# Altium schematic sheet Servo3.SchDoc
size 420 x 297 mm; SheetNumber: 17; SheetTotal: 26
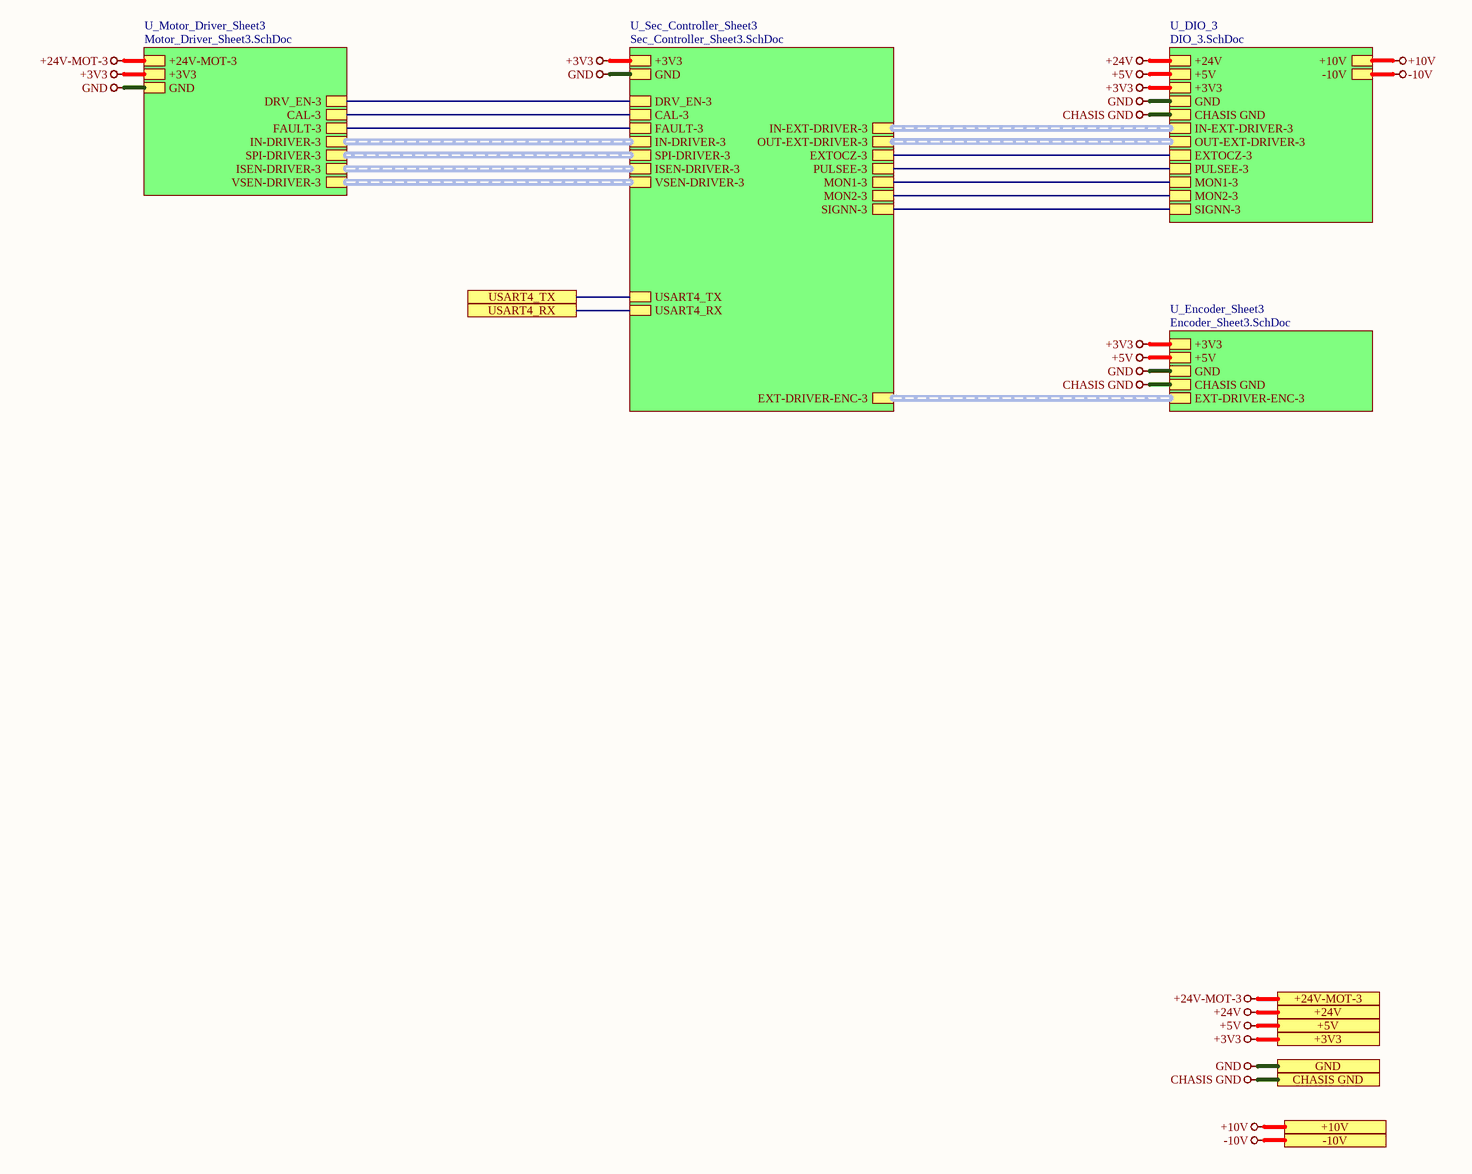
[diagram p0: Servo3.SchDoc]

## Sub-sheets
U_DIO_3 = DIO_3.SchDoc: +24V, +5V, GND, +3V3, CHASIS GND, IN-EXT-DRIVER-3 (harness IN-EXT-DRIVER-3), OUT-EXT-DRIVER-3 (harness OUT-EXT-DRIVER-3), EXTOCZ-3, PULSEE-3, MON1-3, MON2-3, SIGNN-3, +10V, -10V
U_Encoder_Sheet3 = Encoder_Sheet3.SchDoc: +3V3, +5V, GND, CHASIS GND, EXT-DRIVER-ENC-3 (harness EXT-DRIVER-ENC-3)
U_Motor_Driver_Sheet3 = Motor_Driver_Sheet3.SchDoc: +24V-MOT-3, +3V3, GND, DRV_EN-3, CAL-3, FAULT-3, IN-DRIVER-3 (harness IN-DRIVER-3), SPI-DRIVER-3 (harness SPI-DRIVER-3), ISEN-DRIVER-3 (harness ISEN-DRIVER-3), VSEN-DRIVER-3 (harness VSEN-DRIVER-3)
U_Sec_Controller_Sheet3 = Sec_Controller_Sheet3.SchDoc: +3V3, GND, IN-DRIVER-3 (harness IN-DRIVER-3), DRV_EN-3, CAL-3, FAULT-3, SPI-DRIVER-3 (harness SPI-DRIVER-3), ISEN-DRIVER-3 (harness ISEN-DRIVER-3), EXT-DRIVER-ENC-3 (harness EXT-DRIVER-ENC-3), IN-EXT-DRIVER-3 (harness IN-EXT-DRIVER-3), OUT-EXT-DRIVER-3 (harness OUT-EXT-DRIVER-3), EXTOCZ-3, PULSEE-3, MON1-3, MON2-3, SIGNN-3, USART4_TX, USART4_RX, VSEN-DRIVER-3 (harness VSEN-DRIVER-3)

## Ports
+3V3 (see Top_Sheet[5B], CAN_Sheet[4D], Controller_Sheet[5D], DIO_1[5D], DIO_2[5D], DIO_3[5D], DIO_4[5D], Encoder_Sheet1[5D], Encoder_Sheet2[4D], Encoder_Sheet3[4D], Encoder_Sheet4[5D], EtherCAT_Sheet[5D], Motor_Driver_Sheet1[5D], Motor_Driver_Sheet2[5D], Motor_Driver_Sheet3[5D], Motor_Driver_Sheet4[5D], Power_Sheet[5D], RS485_RS232_Sheet[5D], Sec_Controller_Sheet1[5D], Sec_Controller_Sheet2[5D], Sec_Controller_Sheet3[5D], Sec_Controller_Sheet4[5D], Servo1[5D], Servo2[5D], Servo4[5D]), +5V (see Top_Sheet[5B], CAN_Sheet[4D], Controller_Sheet[5D], DIO_1[5D], DIO_2[5D], DIO_3[5D], DIO_4[5D], Encoder_Sheet1[5D], Encoder_Sheet2[4D], Encoder_Sheet3[4D], Encoder_Sheet4[5D], Power_Sheet[5D], Servo1[5D], Servo2[5D], Servo4[5D]), +10V (see Top_Sheet[5C], DIO_1[5D], DIO_2[5D], DIO_3[5D], DIO_4[5D], Power_Sheet[5D], Servo1[5D], Servo2[5D], Servo4[5D]), +24V (see Top_Sheet[5B], DIO_1[5D], DIO_2[5D], DIO_3[5D], DIO_4[5D], Power_Sheet[5D], Servo1[5D], Servo2[5D], Servo4[5D]), +24V-MOT-3 (see Top_Sheet[5C], Motor_Driver_Sheet3[5D], Power_Sheet[5D]), -10V (see Top_Sheet[5C], DIO_1[5D], DIO_2[5D], DIO_3[5D], DIO_4[5D], Power_Sheet[5D], Servo1[5D], Servo2[5D], Servo4[5D]), CHASIS GND (see Top_Sheet[5B], DIO_1[5D], DIO_2[5D], DIO_3[5D], DIO_4[5D], Encoder_Sheet1[5D], Encoder_Sheet2[4D], Encoder_Sheet3[4D], Encoder_Sheet4[5D], EtherCAT_Sheet[5D], Power_Sheet[5D], Servo1[5D], Servo2[5D], Servo4[5D]), GND (see Top_Sheet[5B], CAN_Sheet[4D], Controller_Sheet[5D], DIO_1[5D], DIO_2[5D], DIO_3[5D], DIO_4[5D], Encoder_Sheet1[5D], Encoder_Sheet2[4D], Encoder_Sheet3[4D], Encoder_Sheet4[5D], EtherCAT_Sheet[5D], Motor_Driver_Sheet1[5D], Motor_Driver_Sheet2[5D], Motor_Driver_Sheet3[5D], Motor_Driver_Sheet4[5D], Power_Sheet[5D], RS485_RS232_Sheet[5D], Sec_Controller_Sheet1[5D], Sec_Controller_Sheet2[5D], Sec_Controller_Sheet3[5D], Sec_Controller_Sheet4[5D], Servo1[5D], Servo2[5D], Servo4[5D]), USART4_RX (see Top_Sheet[5B], Controller_Sheet[4D], Sec_Controller_Sheet3[5D]), USART4_TX (see Top_Sheet[5B], Controller_Sheet[4D], Sec_Controller_Sheet3[5D])

## Nets
+3V3: port +3V3, sheet U_Sec_Controller_Sheet3/+3V3, sheet U_Motor_Driver_Sheet3/+3V3, sheet U_Encoder_Sheet3/+3V3, sheet U_DIO_3/+3V3
+5V: port +5V, sheet U_Encoder_Sheet3/+5V, sheet U_DIO_3/+5V
+10V: port +10V, sheet U_DIO_3/+10V
+24V: port +24V, sheet U_DIO_3/+24V
+24V-MOT-3: port +24V-MOT-3, sheet U_Motor_Driver_Sheet3/+24V-MOT-3
-10V: port -10V, sheet U_DIO_3/-10V
CHASIS GND: port CHASIS GND, sheet U_Encoder_Sheet3/CHASIS GND, sheet U_DIO_3/CHASIS GND
GND: port GND, sheet U_Sec_Controller_Sheet3/GND, sheet U_Motor_Driver_Sheet3/GND, sheet U_Encoder_Sheet3/GND, sheet U_DIO_3/GND
USART4_RX: port USART4_RX, sheet U_Sec_Controller_Sheet3/USART4_RX
USART4_TX: port USART4_TX, sheet U_Sec_Controller_Sheet3/USART4_TX
(unnamed): sheet U_Sec_Controller_Sheet3/DRV_EN-3, sheet U_Motor_Driver_Sheet3/DRV_EN-3
(unnamed): sheet U_Sec_Controller_Sheet3/CAL-3, sheet U_Motor_Driver_Sheet3/CAL-3
(unnamed): sheet U_Sec_Controller_Sheet3/FAULT-3, sheet U_Motor_Driver_Sheet3/FAULT-3
(unnamed): sheet U_Sec_Controller_Sheet3/EXTOCZ-3, sheet U_DIO_3/EXTOCZ-3
(unnamed): sheet U_Sec_Controller_Sheet3/PULSEE-3, sheet U_DIO_3/PULSEE-3
(unnamed): sheet U_Sec_Controller_Sheet3/MON1-3, sheet U_DIO_3/MON1-3
(unnamed): sheet U_Sec_Controller_Sheet3/MON2-3, sheet U_DIO_3/MON2-3
(unnamed): sheet U_Sec_Controller_Sheet3/SIGNN-3, sheet U_DIO_3/SIGNN-3

## Buses and harness runs
harness sheet U_DIO_3/IN-EXT-DRIVER-3 = sheet U_Sec_Controller_Sheet3/IN-EXT-DRIVER-3
harness sheet U_DIO_3/OUT-EXT-DRIVER-3 = sheet U_Sec_Controller_Sheet3/OUT-EXT-DRIVER-3
harness sheet U_Encoder_Sheet3/EXT-DRIVER-ENC-3 = sheet U_Sec_Controller_Sheet3/EXT-DRIVER-ENC-3
harness sheet U_Motor_Driver_Sheet3/IN-DRIVER-3 = sheet U_Sec_Controller_Sheet3/IN-DRIVER-3
harness sheet U_Motor_Driver_Sheet3/ISEN-DRIVER-3 = sheet U_Sec_Controller_Sheet3/ISEN-DRIVER-3
harness sheet U_Motor_Driver_Sheet3/SPI-DRIVER-3 = sheet U_Sec_Controller_Sheet3/SPI-DRIVER-3
harness sheet U_Motor_Driver_Sheet3/VSEN-DRIVER-3 = sheet U_Sec_Controller_Sheet3/VSEN-DRIVER-3

## Notes on the sheet
- File:
- Title:
- Date:
- Page
- Num:
- Total:
- Drawn By: Huzaifa Ali